# Altium schematic sheet PowerSupply.SchDoc
size A4; CompanyName: HEPL; Address1: Quai Gloesener 6; Address2: 4020, liege; SheetNumber: 5; SheetTotal: 5
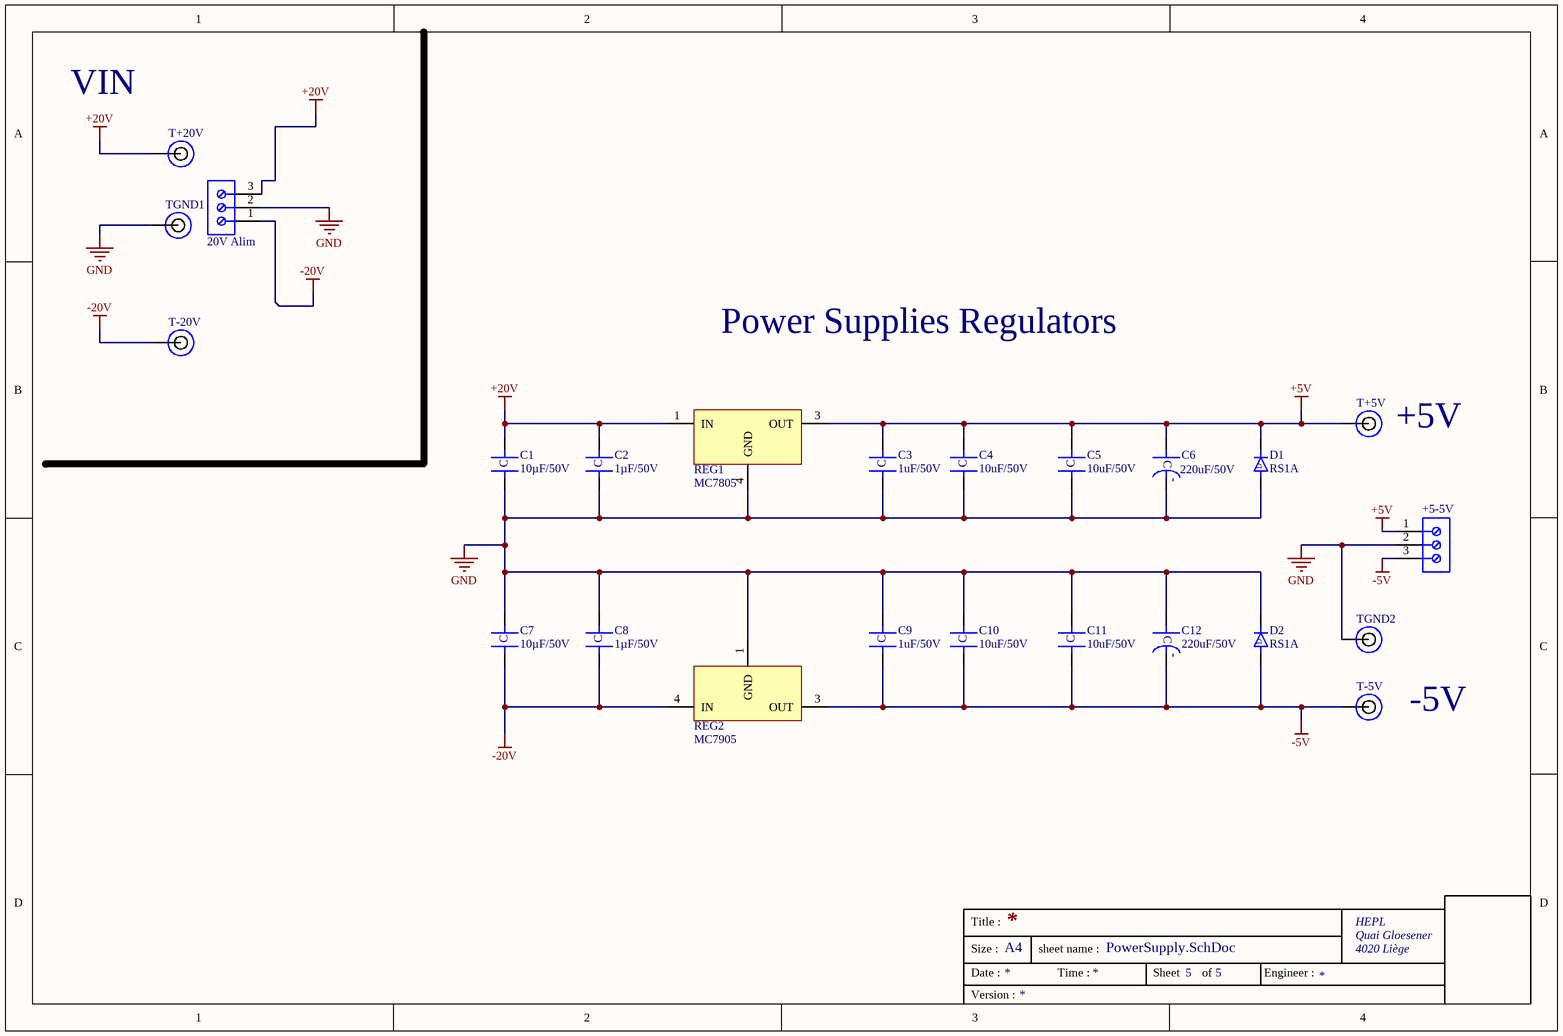
[diagram p0: PowerSupply.SchDoc]

## Parts
20V_Alim  val?  [691214110003]  (value not drawn)
+5-5V  val?  [691214110003]  (value not drawn)
C1  10µF/50V  [1206-C]
C2  1µF/50V  [1206-C]
C3  1uF/50V  [1206-C]
C4  10uF/50V  [1206-C]
C5  10uF/50V  [1206-C]
C6  220uF/50V  [C100x160]
C7  10µF/50V  [1206-C]
C8  1µF/50V  [1206-C]
C9  1uF/50V  [1206-C]
C10  10uF/50V  [1206-C]
C11  10uF/50V  [1206-C]
C12  220uF/50V  [C100x160]
D1  RS1A  [DO-214AC]
D2  RS1A  [DO-214AC]
REG1  MC7805  [D2PAK254P1420X457-3N]
REG2  MC7905  [D2PAK254P1420X457-3N]
T+5V  (no value)  [Test Point 1.32mm]
T+20V  (no value)  [Test Point 1.32mm]
T-5V  (no value)  [Test Point 1.32mm]
T-20V  (no value)  [Test Point 1.32mm]
TGND1  (no value)  [Test Point 1.32mm]
TGND2  (no value)  [Test Point 1.32mm]

## Nets
+5V: +5-5V.1 C3.2 C4.2 C5.2 C6.1 D1.2(cathode) REG1.3(OUT) T+5V.1
+20V: 20V_Alim.3 C1.2 C2.2 REG1.1(IN) T+20V.1
-5V: +5-5V.3 C9.1 C10.1 C11.1 C12.2 D2.1(Anode) REG2.3(OUT) T-5V.1
-20V: 20V_Alim.1 C7.1 C8.1 REG2.4(IN) T-20V.1
GND: 20V_Alim.2 +5-5V.2 C1.1 C2.1 C3.1 C4.1 C5.1 C6.2 C7.2 C8.2 C9.2 C10.2 C11.2 C12.1 D1.1(Anode) D2.2(cathode) REG1.4(GND) REG2.1(GND) TGND1.1 TGND2.1

## Notes on the sheet
- VIN
- Power Supplies Regulators
- (near T+5V) +5V
- -5V
- Title :
- HEPL
- Size :
- Date :
- A4
- sheet name :
- Time :
- Sheet
- of
- Engineer :
- Quai Gloesener
- 4020 Liège
- Version :
- (in symbol Capacitor-NP) C
- (in symbol Capacitor-Pol) C; -
- (in symbol Diode) D

## Library data of the parts
20V_Alim +5-5V = Screw Terminal 3x: Manufacturer: WE; Manufacturer Part Number: 691-214110-003; Supplier: mouser; Supplier Part Number: 710-691214110003; Supplier Unit Price: 1.16; MOQ: 1
C1-C5 C7-C11 = Capacitor-NP: Manufacturer: *; Manufacturer Part Number: *; Supplier: *; Supplier Part Number: *; Supplier Unit Price: *; MOQ: *
C6 C12 = Capacitor-Pol: Manufacturer: *; Manufacturer Part Number: *; Supplier: *; Supplier Part Number: *; Supplier Unit Price: *; MOQ: *
D1 D2 = Diode: Clamp Diode 1A 1.1 V / RS1A; Manufacturer: ONSEMI; Manufacturer Part Number: RS1A; Supplier: Mouser; Supplier Part Number: 512-RS1A; Supplier Unit Price: 0.372; MOQ: 1
REG1 = MC7800: Voltage Regulators –Positive-1.0 A - 5V; Manufacturer: onsemi; Manufacturer Part Number: MC7805BD2TR4G; Supplier: Mouser; Supplier Part Number: 863-MC7805BD2TR4G; Supplier Unit Price: 0.90; MOQ: 1
REG2 = MC7900: Voltage Regulators –Negative-1.0 A; Manufacturer: onsemi; Manufacturer Part Number: MC7905ACD2TR4G; Supplier: Mouser; Supplier Part Number: 863-MC7905ACD2TR4G; Supplier Unit Price: 0.809; MOQ: 1
T+5V T+20V T-5V T-20V TGND1 TGND2 = Test Point: PCB Test Point, Type 8 Series, Black, Through Hole Mount, 1.32 mm, Phosphor Bronze; Manufacturer: VERO; Manufacturer Part Number: 20-2136; Supplier Part Number: 8731195; Supplier: Farnell; Supplier Unit Price: 0.132; MOQ: 100